# EAGLE design Fahrzeug (EAGLE 7.7.0)

## Sheet 1 of 2
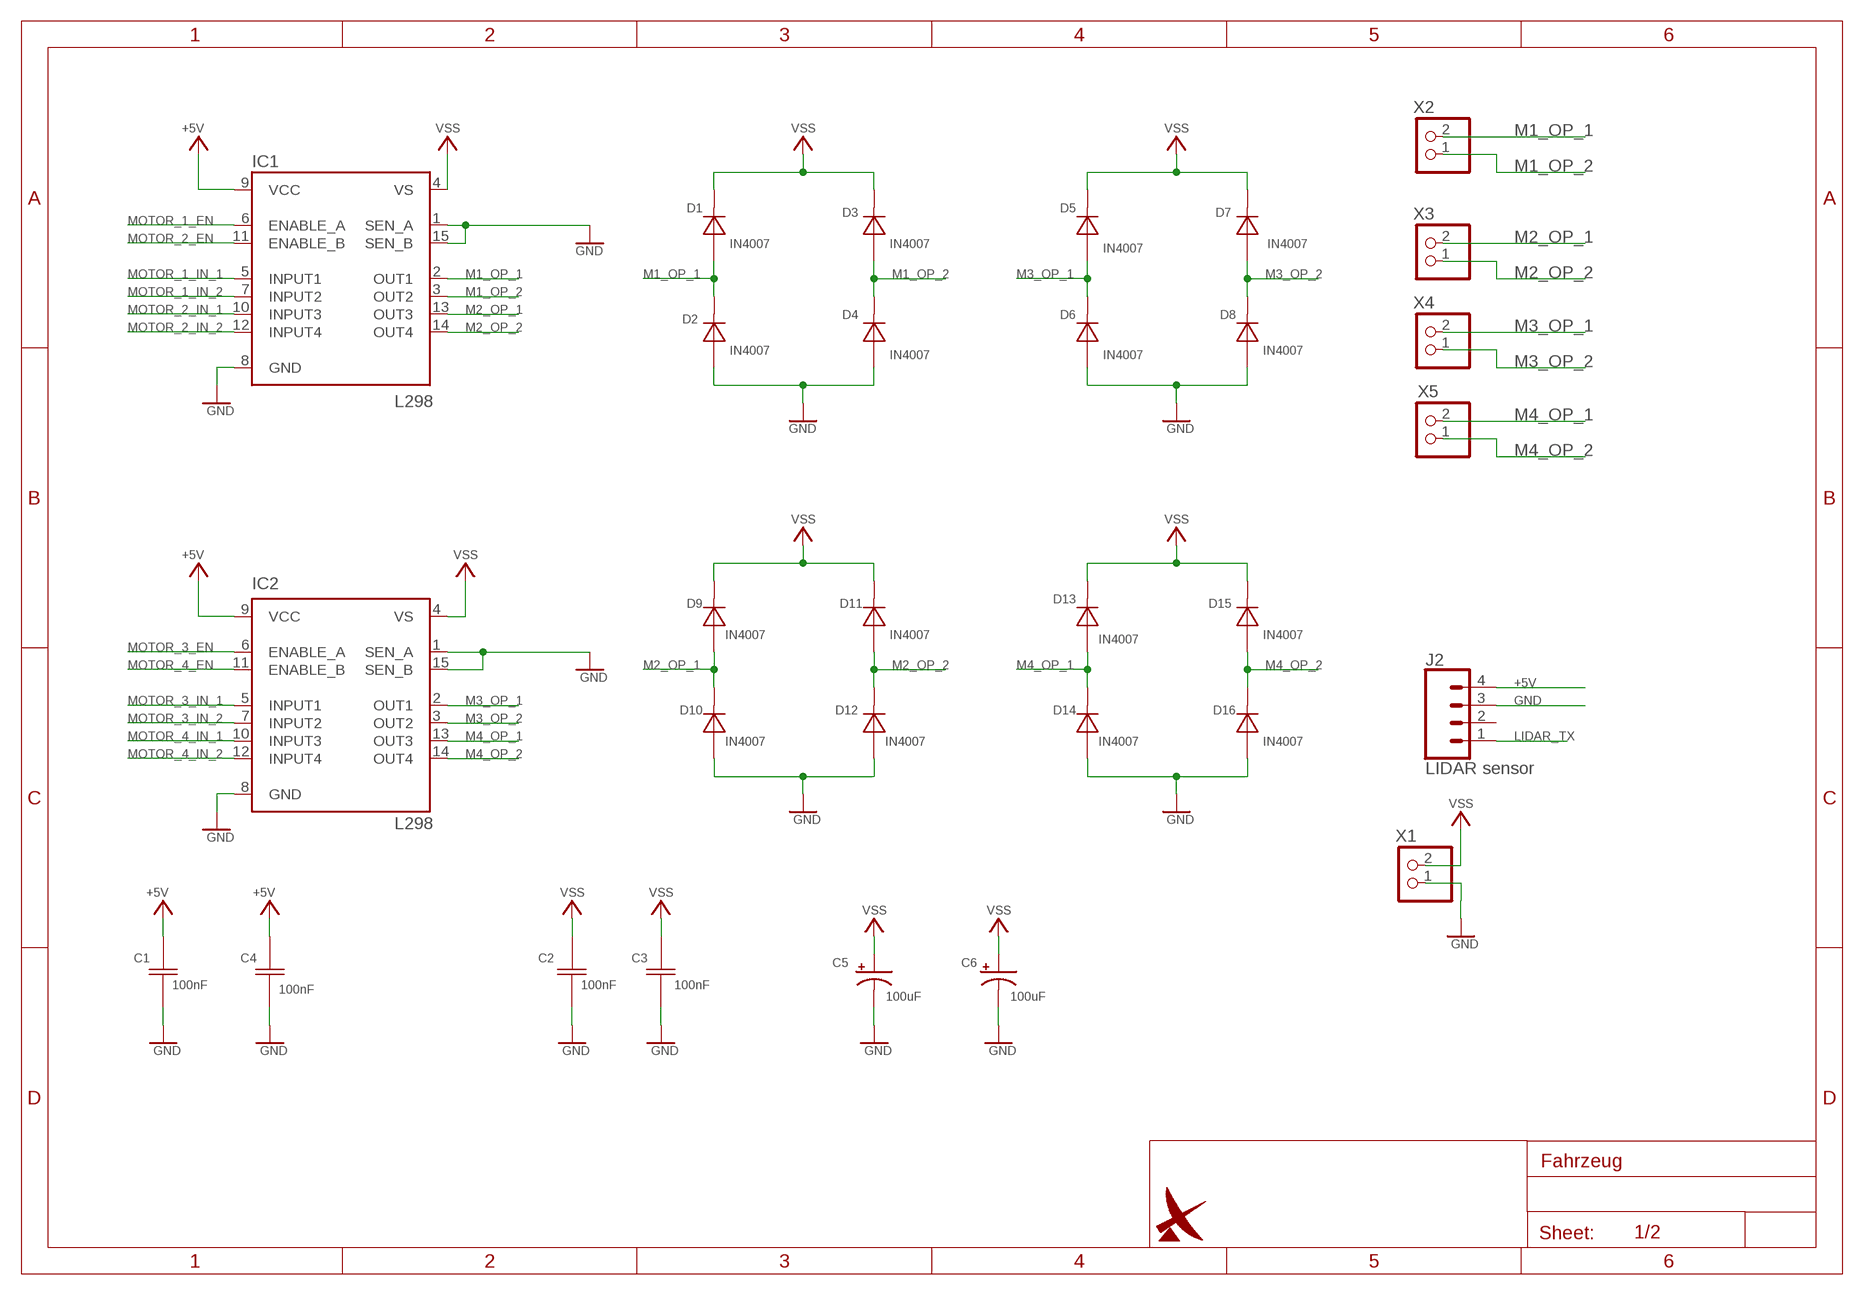
[diagram p0: schematic, sheet 1]

### Parts
C1  100nF  C1206  [R1206]
C2  100nF  C1206  [R1206]
C3  100nF  C1206  [R1206]
C4  100nF  C1206  [R1206]
C5  100uF  100UF-POLAR-RADIAL-2.5MM-25V-20%  [CPOL-RADIAL-2.5MM-6.5MM]
C6  100uF  100UF-POLAR-RADIAL-2.5MM-25V-20%  [CPOL-RADIAL-2.5MM-6.5MM]
D1  IN4007  DIODEDO214AC  [DO214AC]
D2  IN4007  DIODEDO214AC  [DO214AC]
D3  IN4007  DIODEDO214AC  [DO214AC]
D4  IN4007  DIODEDO214AC  [DO214AC]
D5  IN4007  DIODEDO214AC  [DO214AC]
D6  IN4007  DIODEDO214AC  [DO214AC]
D7  IN4007  DIODEDO214AC  [DO214AC]
D8  IN4007  DIODEDO214AC  [DO214AC]
D9  IN4007  DIODEDO214AC  [DO214AC]
D10  IN4007  DIODEDO214AC  [DO214AC]
D11  IN4007  DIODEDO214AC  [DO214AC]
D12  IN4007  DIODEDO214AC  [DO214AC]
D13  IN4007  DIODEDO214AC  [DO214AC]
D14  IN4007  DIODEDO214AC  [DO214AC]
D15  IN4007  DIODEDO214AC  [DO214AC]
D16  IN4007  DIODEDO214AC  [DO214AC]
IC1  L298  [MULTIWATT-15]
IC2  L298  [MULTIWATT-15]
J2  LIDAR sensor  CONN_04POLAR  [MOLEX-1X4]
X1  PINHD-1X2  [1X02]
X2  PINHD-1X2  [1X02]
X3  PINHD-1X2  [1X02]
X4  PINHD-1X2  [1X02]
X5  PINHD-1X2  [1X02]

### Nets
+5V: C1.2 C4.2 IC1.9(VCC) IC2.9(VCC) J2.4 ; also sheet 2
GND: C1.1 C2.1 C3.1 C4.1 C5.2(-) C6.2(-) D2.A D4.A D6.A D8.A D10.A D12.A D14.A D16.A IC1.1(SEN_A) IC1.8(GND) IC1.15(SEN_B) IC2.1(SEN_A) IC2.8(GND) IC2.15(SEN_B) J2.3 X1.1 ; also sheet 2
LIDAR_TX: J2.1 ; also sheet 2
M1_OP_1: D1.A D2.C IC1.2(OUT1) X2.2
M1_OP_2: D3.A D4.C IC1.3(OUT2) X2.1
M2_OP_1: D9.A D10.C IC1.13(OUT3) X3.2
M2_OP_2: D11.A D12.C IC1.14(OUT4) X3.1
M3_OP_1: D5.A D6.C IC2.2(OUT1) X4.2
M3_OP_2: D7.A D8.C IC2.3(OUT2) X4.1
M4_OP_1: D13.A D14.C IC2.13(OUT3) X5.2
M4_OP_2: D15.A D16.C IC2.14(OUT4) X5.1
MOTOR_1_EN: IC1.6(ENABLE_A) ; also sheet 2
MOTOR_1_IN_1: IC1.5(INPUT1) ; also sheet 2
MOTOR_1_IN_2: IC1.7(INPUT2) ; also sheet 2
MOTOR_2_EN: IC1.11(ENABLE_B) ; also sheet 2
MOTOR_2_IN_1: IC1.10(INPUT3) ; also sheet 2
MOTOR_2_IN_2: IC1.12(INPUT4) ; also sheet 2
MOTOR_3_EN: IC2.6(ENABLE_A) ; also sheet 2
MOTOR_3_IN_1: IC2.5(INPUT1) ; also sheet 2
MOTOR_3_IN_2: IC2.7(INPUT2) ; also sheet 2
MOTOR_4_EN: IC2.11(ENABLE_B) ; also sheet 2
MOTOR_4_IN_1: IC2.10(INPUT3) ; also sheet 2
MOTOR_4_IN_2: IC2.12(INPUT4) ; also sheet 2
VSS: C2.2 C3.2 C5.1(+) C6.1(+) D1.C D3.C D5.C D7.C D9.C D11.C D13.C D15.C IC1.4(VS) IC2.4(VS) X1.2 ; also sheet 2
Unconnected: J2.2

## Sheet 2 of 2
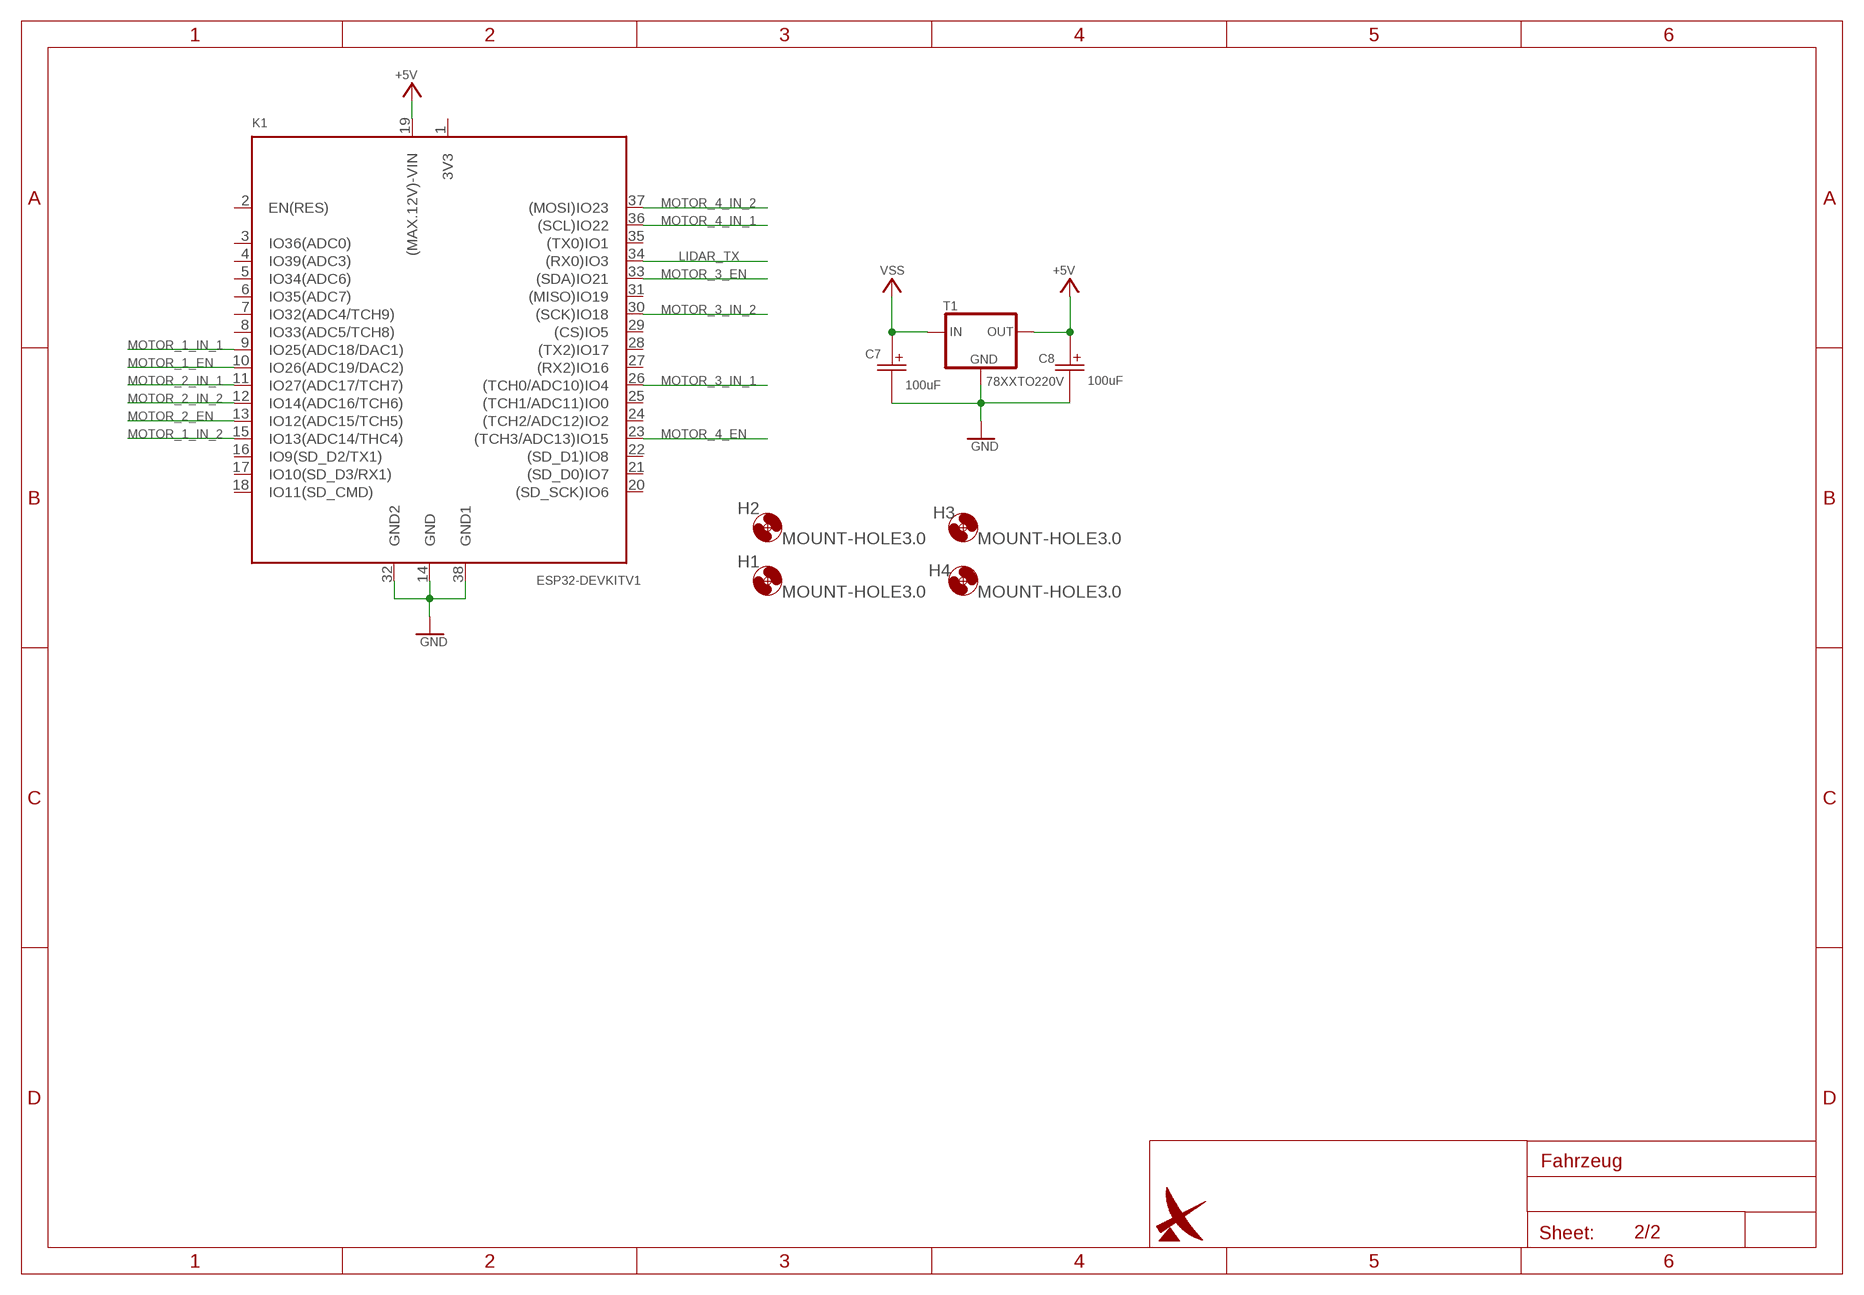
[diagram p1: schematic, sheet 2]

### Parts
C7  100uF  ELKORM2,5-DM5  [E2,5-5]
C8  100uF  ELKORM2,5-DM5  [E2,5-5]
H1  MOUNT-HOLE3.0  [3,0]
H2  MOUNT-HOLE3.0  [3,0]
H3  MOUNT-HOLE3.0  [3,0]
H4  MOUNT-HOLE3.0  [3,0]
K1  ESP32DEVKITV11000MIL  [ESP32-DEVKITV1]
T1  78XXTO220V  [78-TO220V]

### Nets
+5V: C8.+ K1.19((MAX.12V)-VIN) T1.OUT ; also sheet 1
GND: C7.- C8.- K1.14(GND) K1.32(GND2) K1.38(GND1) T1.GND ; also sheet 1
LIDAR_TX: K1.34((RX0)IO3) ; also sheet 1
MOTOR_1_EN: K1.10(IO26(ADC19/DAC2)) ; also sheet 1
MOTOR_1_IN_1: K1.9(IO25(ADC18/DAC1)) ; also sheet 1
MOTOR_1_IN_2: K1.15(IO13(ADC14/THC4)) ; also sheet 1
MOTOR_2_EN: K1.13(IO12(ADC15/TCH5)) ; also sheet 1
MOTOR_2_IN_1: K1.11(IO27(ADC17/TCH7)) ; also sheet 1
MOTOR_2_IN_2: K1.12(IO14(ADC16/TCH6)) ; also sheet 1
MOTOR_3_EN: K1.33((SDA)IO21) ; also sheet 1
MOTOR_3_IN_1: K1.26((TCH0/ADC10)IO4) ; also sheet 1
MOTOR_3_IN_2: K1.30((SCK)IO18) ; also sheet 1
MOTOR_4_EN: K1.23((TCH3/ADC13)IO15) ; also sheet 1
MOTOR_4_IN_1: K1.36((SCL)IO22) ; also sheet 1
MOTOR_4_IN_2: K1.37((MOSI)IO23) ; also sheet 1
VSS: C7.+ T1.IN ; also sheet 1
Unconnected: K1.1(3V3) K1.2(EN(RES)) K1.3(IO36(ADC0)) K1.4(IO39(ADC3)) K1.5(IO34(ADC6)) K1.6(IO35(ADC7)) K1.7(IO32(ADC4/TCH9)) K1.8(IO33(ADC5/TCH8)) K1.16(IO9(SD_D2/TX1)) K1.17(IO10(SD_D3/RX1)) K1.18(IO11(SD_CMD)) K1.20((SD_SCK)IO6) K1.21((SD_D0)IO7) K1.22((SD_D1)IO8) K1.24((TCH2/ADC12)IO2) K1.25((TCH1/ADC11)IO0) K1.27((RX2)IO16) K1.28((TX2)IO17) K1.29((CS)IO5) K1.31((MISO)IO19) K1.35((TX0)IO1)

## Library data of the parts
C1-C4 = HTL22_basis:C: Kondensatoren Ungepolte Kondensatoren nach den gültigen Normen : IEC 60617 und EN 81346-2 Folgende Baugrößen sind enthalten: 2,4mm x 4,4mm RM2,54 = 100mil 2,5mm x 5,0mm RM2,54 = 100mil 3,0mm x 5,0mm RM2,54 = 100mil SMD: 0805 und 1206 Datum: 05.10.2018 erstellt von: neca@htl-donaustadt.at
C5 C6 = SparkFun-Capacitors:100UF-POLAR: 100µF polarized capacitors A capacitor is a passive two-terminal electrical component used to store electrical energy temporarily in an electric field.; PROD_ID: CAP-08439
C7 C8 = HTL22_basis:ELKO: ELKO Gepolte Kondensatoren nach den gültigen Normen : IEC 60617 und EN 81346-2 Folgende Baugrößen sind enthalten: D=5mm / RM2,54 = 100mil D=6mm / RM2,54 = 100mil D=7mm / RM2,54 = 100mil Datum: 05.10.2018 erstellt von: neca@htl-donaustadt.at
D1-D16 = HTL22_basis:DIODE: Diode Halbleiterioden nach den gültigen Normen : IEC 60617 und EN 81346-2 Folgende Baugrößen sind enthalten: DO-34 Rastermaß 7,5mm DO-34 Rastermaß 10mm DO-35 Rastermaß 7,5mm DO-35 Rastermaß 10mm DO-41 Rastermaß 10mm DO-41 Rastermaß 12mm DO214AB oder SMC DO214AA oder SMB DO214AC oder SMA SOD87 (MELF) SOD80 (MINI-MELF) Datum: 05.10.2018 erstellt von: neca@htl-donaustadt.at
H1-H4 = holes:MOUNT-HOLE: MOUNTING HOLE with drill center marker
IC1 IC2 = st-microelectronics:L298: DUAL FULL-BRIDGE DRIVER; MPN: L298N; OC_FARNELL: 1589425; OC_NEWARK: 32M1527
J2 = SparkFun-Connectors:CONN_04: Multi connection point. Often used as Generic Header-pin footprint for 0.1 inch spaced/style header connections On any of the 0.1 inch spaced packages, you can populate with these: Break Away Headers - Straight <https://www.sparkfun.com/products/116> (PRT-00116) Break Away Male Headers - Right Angle <https://www.sparkfun.com/products/553> (PRT-00553) Female Headers <https://www.sparkfun.com/products/115> (PRT-00115) Break Away Headers - Machine Pin <https://www.sparkfun.com/products/117> (PRT-00117) Break Away Female Headers - Swiss Machine Pin <https://www.sparkfun.com/products/743> (PRT-00743) For SCREWTERMINALS and SPRING TERMINALS visit here: Screw Terimnals on SparkFun.com <https://www.sparkfun.com/search/results?term=Screw+Terminals> (5mm/3.5mm/2.54mm spacing) This device is also useful as a general connection point to wire up your design to another part of your project. Our various solder wires solder well into these plated through hole pads. Hook-Up Wire - Assortment (Stranded, 22 AWG) <https://www.sparkfun.com/products/11375> (PRT-11375) Hook-Up Wire - Assortment (Solid Core, 22 AWG) <https://www.sparkfun.com/products/11367> (PRT-11367) View the entire wire category on our website here <https://www.sparkfun.com/categories/141> Special notes: Molex polarized connector foot print use with SKU : PRT-08231 with associated crimp pins and housings. 1MM SMD Version SKU: PRT-10208; PROD_ID: CONN-08186; SF_ID: PRT-08231
K1 = HTL22_Eagle7_Controller:ESP32DEVKITV1: ESP32, Diverse
T1 = HTL22_basis:78XX: Positive Spannungsregler der Serie 78xx Folgende Baugrößen sind enthalten: TO-92 TO-220 Horizontal TO-220 Vertikal SIP3 SpannungswandlerVertikal Datum: 17.12.2018 erstellt von: neca@htl-donaustadt.at
X1-X5 = HTL22_kontakte:PINHD-1X2: PIN HEADER

## Board
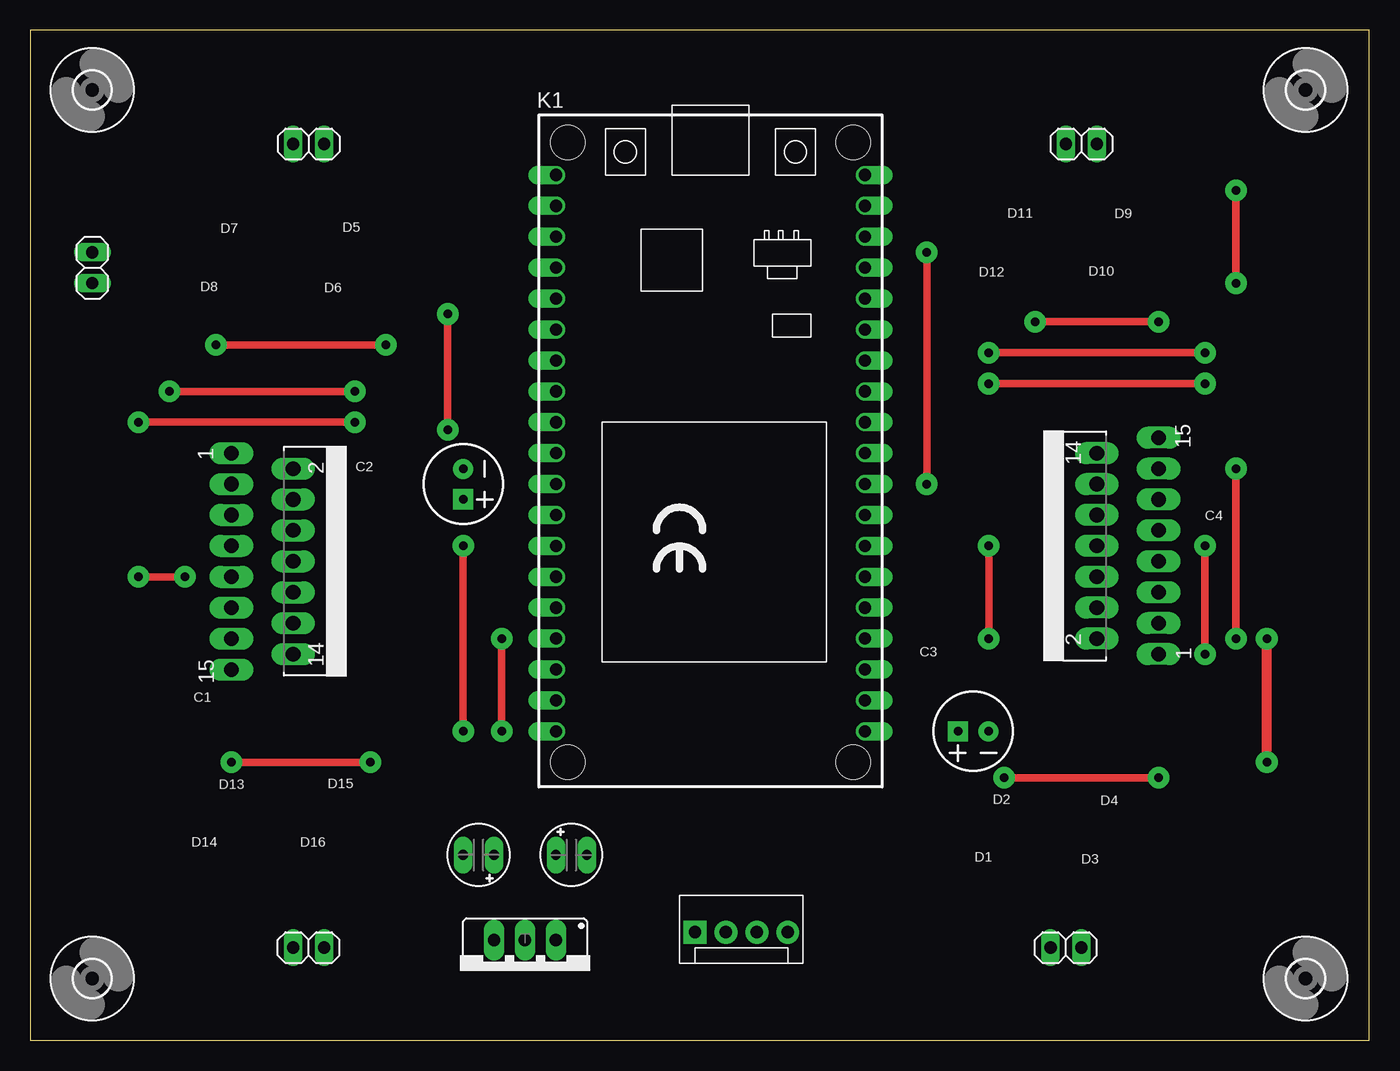
[diagram p2: board, top side]
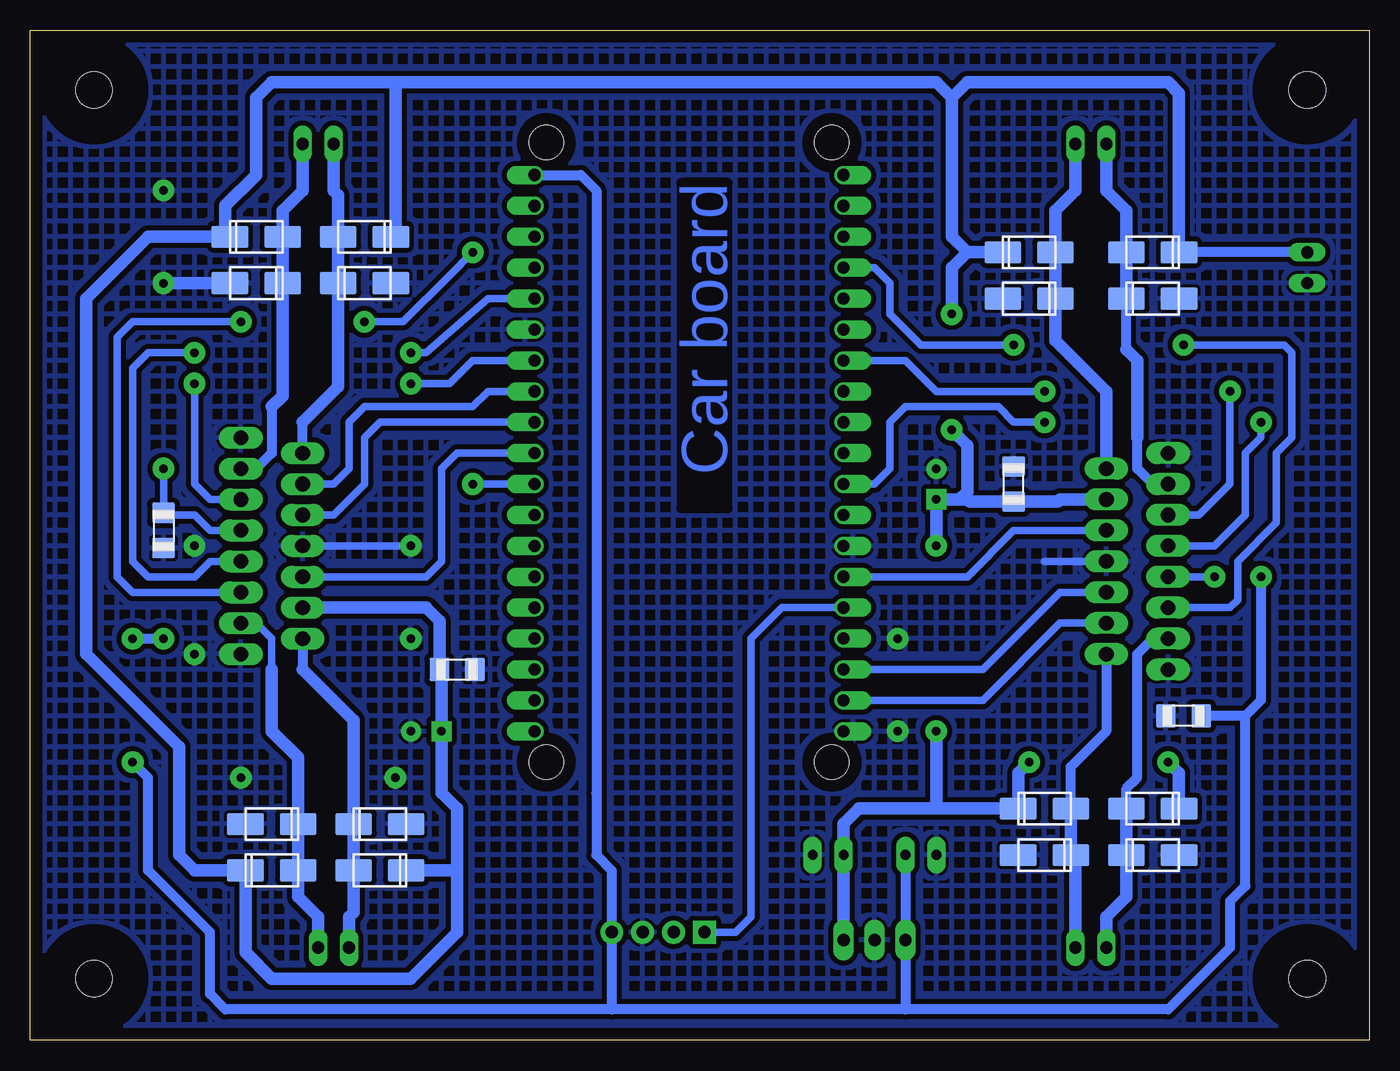
[diagram p3: board, bottom side, seen from below]

Size 110 x 83 mm. Coordinates in mm from the lower left corner, seen from the top.
Outline: 0,0 110,0 110,83 0,83 0,0
Copper layers (1*16): Top 0.035mm / dielectric 1.5mm / Bottom 0.035mm
Design rules "default *": minimum track width 10mil, minimum drill 24mil, track to track 12mil, track to pad 12mil, pad to pad 12mil, via to via 12mil, smd to smd 12mil, copper to edge 40mil, drill to drill 8mil, minimum pad ring 10mil, minimum via ring 8mil, stop-mask expansion 4mil, vias tented up to drill 0mil, thermal gap 10mil

### Footprints (pad centres in the part's own frame; a part is rotated, then mirrored left to right if it is on the bottom)
R1206 = smd 1.651 x 1.905: 1 -1.448,0; 2 1.448,0
CPOL-RADIAL-2.5MM-6.5MM = drill 0.7 pad 1.651 square: 1 1.25,0 | drill 0.7 pad 1.651: 2 -1.25,0
E2,5-5 = drill 0.8 pad 1.524 long: + -1.27,0; - 1.27,0
DO214AC = smd 3 x 1.8: A -2.16,0; C 2.16,0
3,0 = hole 3: 0,0
MULTIWATT-15 = drill 1.2 long: 1 -8.89,-7.62; 2 -7.62,-2.54; 3 -6.35,-7.62; 4 -5.08,-2.54; 5 -3.81,-7.62; 6 -2.54,-2.54; 7 -1.27,-7.62; 8 0,-2.54; 9 1.27,-7.62; 10 2.54,-2.54; 11 3.81,-7.62; 12 5.08,-2.54; 13 6.35,-7.62; 14 7.62,-2.54; 15 8.89,-7.62
MOLEX-1X4 = drill 1.016 pad 1.88 square: 1 0,0 | drill 1.016 pad 1.88: 2 2.54,0; 3 5.08,0; 4 7.62,0
ESP32-DEVKITV1 = drill 1 pad 1.422 offset: 1 0,0; 2 2.54,0; 3 5.08,0; 4 7.62,0; 5 10.16,0; 6 12.7,0; 7 15.24,0; 8 17.78,0; 9 20.32,0; 10 22.86,0; 11 25.4,0; 12 27.94,0; 13 30.48,0; 14 33.02,0; 15 35.56,0; 16 38.1,0; 17 40.64,0; 18 43.18,0; 19 45.72,0; 20 45.72,25.4; 21 43.18,25.4; 22 40.64,25.4; 23 38.1,25.4; 24 35.56,25.4; 25 33.02,25.4; 26 30.48,25.4; 27 27.94,25.4; 28 25.4,25.4; 29 22.86,25.4; 30 20.32,25.4; 31 17.78,25.4; 32 15.24,25.4; 33 12.7,25.4; 34 10.16,25.4; 35 7.62,25.4; 36 5.08,25.4; 37 2.54,25.4; 38 0,25.4 | hole 2.8: 48.387,0.965; 48.387,24.435; -2.54,24.435; -2.54,0.965
78-TO220V = drill 1.016 pad 1.676 long: GND 0,0; IN -2.54,0; OUT 2.54,0
1X02 = drill 1.016 pad 1.524 long: 1 -1.27,0; 2 1.27,0

### Placement (x,y rotation side)
C1  15.24,26.67 0 bottom
C2  29.21,45.72 270 bottom
C3  74.93,30.48 180 bottom
C4  99.06,41.91 90 bottom
C5  77.47,25.4 180 top
C6  35.56,45.72 270 top
C7  44.45,15.24 0 top
C8  36.83,15.24 180 top
D1  81.28,13.97 0 bottom
D2  81.28,17.78 180 bottom
D3  90.17,13.97 180 bottom
D4  90.17,17.78 0 bottom
D5  27.94,64.77 180 bottom
D6  27.94,60.96 0 bottom
D7  17.78,64.77 0 bottom
D8  17.78,60.96 180 bottom
D9  91.44,66.04 180 bottom
D10  91.44,62.23 0 bottom
D11  82.55,66.04 0 bottom
D12  82.55,62.23 180 bottom
D13  17.78,19.05 0 bottom
D14  17.78,15.24 180 bottom
D15  26.67,19.05 180 bottom
D16  26.67,15.24 0 bottom
DRILEGEND  [DRILEGEND]  -2.54,-4.83 0 top  (outside the outline)
H1  5.08,5.08 0 top
H2  104.78,78.11 0 top
H3  104.78,5.08 0 top
H4  5.08,78.11 0 top
IC1  85.09,40.64 90 top
IC2  24.13,39.37 270 top
J2  54.61,8.89 0 top
K1  68.58,25.4 90 top
T1  40.64,8.26 180 top
U$3  [ARROW-->]  115,83 90 top  (outside the outline)
U$4  [ARROW-->]  0,88 180 top  (outside the outline)
U$5  [ARROW<--]  110,88 180 top  (outside the outline)
U$6  [ARROW<--]  115,0 90 top  (outside the outline)
X1  5.08,63.5 90 top
X2  85.09,7.62 180 top
X3  86.36,73.66 0 top
X4  22.86,73.66 0 top
X5  22.86,7.62 180 top

### Tracks (layer width: path | path; a pad name or v marks a point on that pad's centre or on a via)
+5V  (via drill 0.7 pad 1.78)
  Top 0.61: v8.89,38.1 v12.7,38.1 | v99.06,33.02 v99.06,46.99
  Top 0.813: v101.6,22.86 v101.6,33.02
  Bottom 0.61: IC2.9 v12.7,38.1 | IC1.9 95.25,41.91 96.52,43.18 98.88,43.18 C4.2 v99.06,46.99
  Bottom 0.813: K1.19 64.77,71.12 63.5,69.85 63.5,20.32 63.5,15.24 62.23,13.97 J2.4 62.23,2.54 | 38.1,2.54 16.51,2.54 11.43,7.62 11.43,11.43 10.16,12.7 10.16,26.67 | 38.1,2.54 62.23,2.54 | 62.23,2.54 93.98,2.54 95.25,3.81 95.25,8.89 100.33,13.97 100.33,21.59 v101.6,22.86 | 38.1,2.54 T1.OUT C8.+ | 10.16,26.67 C1.2 | v8.89,38.1 8.89,27.94 10.16,26.67 | v101.6,33.02 v99.06,33.02
GND  (via drill 0.7 pad 1.78)
  Top 0.61: v80.01,21.59 v92.71,21.59 | v38.73,33.02 v38.73,25.4 | v96.52,40.64 v96.52,31.75 | v78.74,40.64 v78.74,33.02 | v99.06,62.23 v99.06,69.85
  Bottom 0.61: IC2.8 26.67,39.37 | v78.74,40.64 IC1.8
  Bottom 1.016: D10.A v99.06,62.23
  pour Bottom (isolate 0.406, hatched): 110.15,0 110.09,82.88 -0.02,83.32 0,0
LIDAR_TX
  Bottom 0.61: K1.34 48.26,35.56 50.8,33.02 50.8,10.16 52.07,8.89 J2.1
M1_OP_1
  Bottom 0.813: IC1.2 87.63,30.48
  Bottom 1.016: 87.63,30.48 83.44,26.29 D2.C D1.A 83.44,10.54 83.82,10.16 X2.2
M1_OP_2
  Bottom 0.61: 91.44,34.29 90.17,33.02 90.17,30.48
  Bottom 0.813: IC1.3 91.44,34.29
  Bottom 1.016: 90.17,30.48 90.17,25.4 88.01,23.24 D4.C D3.A 88.01,11.81 86.36,10.16 X2.1
M2_OP_1
  Bottom 0.813: 90.17,52.07 90.17,48.26 91.44,46.99 IC1.13
  Bottom 1.016: 90.17,52.07 89.28,52.96 D10.C D9.A 89.28,68.2 87.63,69.85 X3.2
M2_OP_2
  Bottom 0.813: IC1.14 87.63,50.8
  Bottom 1.016: 87.63,50.8 84.71,53.72 D12.C D11.A 84.71,69.47 85.09,69.85 X3.1
M3_OP_1
  Bottom 1.016: IC2.2 21.59,53.34 25.78,57.53 D6.C D5.A 25.78,68.2 24.13,69.85 X4.2
M3_OP_2
  Bottom 0.813: IC2.3 17.78,45.72 19.05,46.99 19.05,49.53 | 19.94,56.77 D8.C
  Bottom 1.016: 19.05,49.53 19.05,55.88 19.94,56.77 | X4.1 21.59,69.85 19.94,68.2 D7.A D8.C
M4_OP_1
  Bottom 0.813: 17.78,33.02 19.05,31.75 19.05,21.59 19.94,20.7 D13.A
  Bottom 1.016: 17.78,33.02 IC2.13 | D13.A D14.C 19.94,11.81 21.59,10.16 X5.2
M4_OP_2
  Bottom 0.813: IC2.14 21.59,25.4 24.51,22.48 D15.A | 24.13,14.86 D16.C
  Bottom 1.016: D16.C D15.A | X5.1 24.13,14.86 24.13,15.24
MOTOR_1_EN
  Bottom 0.61: IC1.6 77.47,38.1 76.2,39.37 76.2,46.99 74.93,48.26 K1.10
MOTOR_1_IN_1  (via drill 0.7 pad 1.78)
  Top 0.61: v92.71,59.05 v82.55,59.05 | v73.66,64.77 v73.66,45.72
  Bottom 0.61: IC1.5 101.6,36.83 102.87,38.1 102.87,57.78 101.6,59.05 v92.71,59.05 | v82.55,59.05 79.38,59.05 75.56,62.87 v73.66,64.77 | v73.66,45.72 K1.9
MOTOR_1_IN_2  (via drill 0.7 pad 1.78)
  Top 0.61: v78.74,56.52 v96.52,56.52
  Bottom 0.61: K1.15 72.39,60.96 77.47,56.52 v78.74,56.52 | v96.52,56.52 100.33,56.52 101.6,55.24 101.6,39.37 100.33,38.1 97.79,38.1 96.52,38.1 95.25,39.37 IC1.7
MOTOR_2_EN  (via drill 0.7 pad 1.78)
  Top 0.61: v78.74,53.98 v96.52,53.98
  Bottom 0.61: v96.52,53.98 96.52,45.72 95.25,44.45 IC1.11 | K1.13 73.66,55.88 75.56,53.98 76.2,53.98 v78.74,53.98
MOTOR_2_IN_1
  Bottom 0.61: IC1.10 85.09,43.18 82.55,45.72 82.55,49.53 81.28,50.8 K1.11
MOTOR_2_IN_2
  Bottom 0.61: IC1.12 85.09,45.72 83.82,46.99 83.82,50.8 82.55,52.07 73.66,52.07 72.39,53.34 K1.12
MOTOR_3_EN
  Bottom 0.61: K1.33 33.02,38.1 29.21,41.91 IC2.6
MOTOR_3_IN_1  (via drill 0.7 pad 1.78)
  Top 0.61: v26.67,53.34 v11.43,53.34
  Bottom 0.61: v11.43,53.34 11.43,45.72 13.97,43.18 IC2.5 | v26.67,53.34 35.56,53.34 38.1,55.88 K1.26
MOTOR_3_IN_2  (via drill 0.7 pad 1.78)
  Top 0.61: v26.67,50.8 v8.89,50.8
  Bottom 0.61: K1.30 40.64,45.72 39.37,46.99 39.37,50.8 38.1,52.07 30.48,52.07 29.21,50.8 v26.67,50.8 | v8.89,50.8 8.89,49.53 10.16,48.26 10.16,43.18 12.7,40.64 IC2.7
MOTOR_4_EN  (via drill 0.7 pad 1.78)
  Top 0.61: v15.24,57.15 v29.21,57.15
  Bottom 0.61: K1.23 40.64,63.5 39.37,62.23 39.37,59.69 36.83,57.15 v29.21,57.15 | IC2.11 12.7,35.56 11.43,35.56 10.79,36.2 10.79,39.37 7.62,42.55 7.62,43.18 7.62,48.26 6.35,49.53 6.35,55.88 6.35,56.52 6.99,57.15 v15.24,57.15
MOTOR_4_IN_1
  Bottom 0.61: IC2.10 25.4,36.83 31.75,30.48 K1.36
MOTOR_4_IN_2
  Bottom 0.61: IC2.12 25.4,34.29 31.75,27.94 K1.37
VSS  (via drill 0.6, 0.7 pad 1.78)
  Top 0.61: v35.56,40.64 v35.56,25.4 | v34.29,50.16 v34.29,59.69 | v16.51,22.86 v27.94,22.86
  Bottom 0.61: v35.54,44.45 C6.1
  Bottom 0.813: X1.2 D7.C
  Bottom 1.016: 35.56,19.05 D15.C 28.83,21.97 v27.94,22.86 | 35.56,19.05 v35.56,25.4 | D13.C 15.62,21.97 v16.51,22.86 | D1.C 74.93,13.97 | 74.93,13.97 74.93,19.05 76.22,20.34 C5.1 76.2,26.69 76.2,30.3 C3.2 76.38,34.47 77.47,35.56 IC1.4 | v35.56,40.64 C6.1 | D11.C 80.01,66.42 80.01,78.74 | T1.IN C7.+ 43.18,17.78 41.91,19.05 35.56,19.05 | 34.29,77.47 35.56,78.74 80.01,78.74 | 80.01,78.74 90.17,78.74 91.44,77.47 91.44,71.12 93.98,68.58 93.98,66.42 D9.C 100.33,66.04 105.41,60.96 105.41,31.75 97.79,24.13 97.79,15.24 96.52,13.97 D3.C 92.33,7.24 90.17,5.08 78.74,5.08 74.93,8.89 74.93,13.97 | 34.29,77.47 34.29,66.04 33.02,64.77 | 33.02,64.77 D5.C | 15.24,64.81 15.24,64.77 D7.C 15.62,77.85 16.51,78.74 33.02,78.74 34.29,77.47 | 33.66,44.45 33.02,44.45 32.84,44.27 C2.2 25.58,44.27 25.4,44.45 IC2.4 | 33.66,44.45 v35.54,44.45 | v34.29,59.69 34.29,63.5 33.02,64.77 | v34.29,50.16 33.02,48.9 33.02,45.09 33.66,44.45

### Text on the board
Bottom: Car board
Measures: 110mm | 83mm
DrillLegend: LAYER-STACK
DrillLegend_01-16: 01-16
DrillLegend_01-20: 01-20